# Altium project turn-signal-indicator.PrjPcb
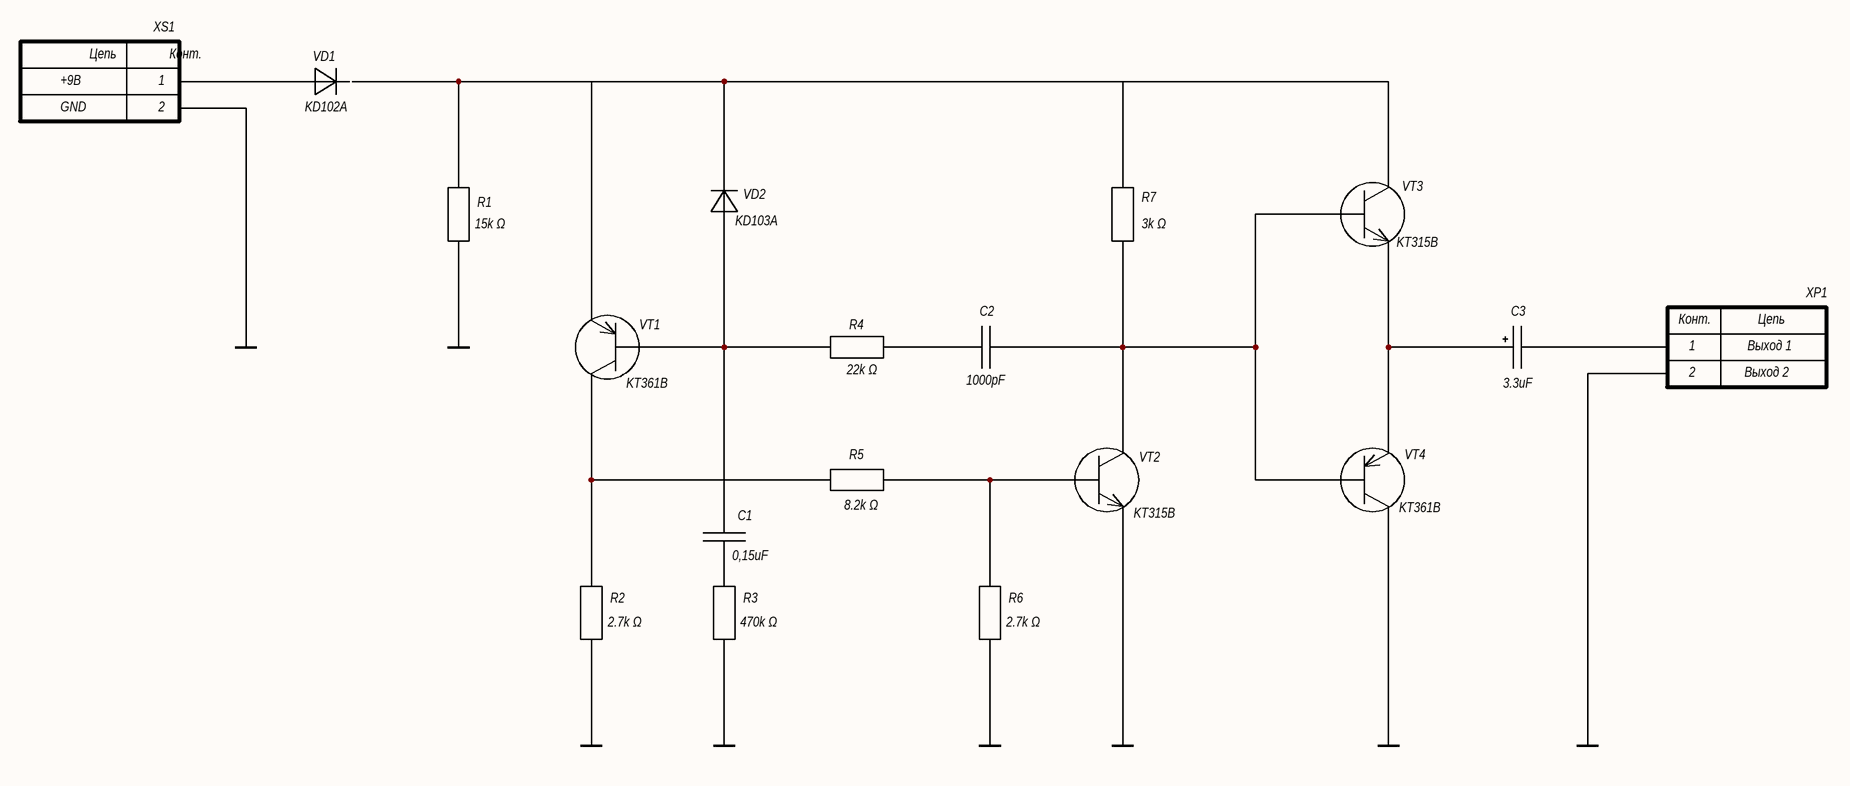
[diagram p0: turn-signal-indicator_E3_schematic.SchDoc]
2 sheets, 18 parts. Net scope: global (net labels, ports and power ports of the same name join across sheets).
Board file: turn-signal-indicator.PcbDoc
Sheets:
  turn-signal-indicator_E3_schematic.SchDoc
  turn-signal-indicator_E1_block-diagram.SchDoc

## Sheet turn-signal-indicator_E3_schematic.SchDoc: Звуковой сигнализатор
size 420 x 297 mm; CheckedBy: Семенцов С.Г.; Author: Советников М.М.; CompanyName: МГТУ им. Н.Э. Баумана Кафедра ИУ4 Группа ИУ4-52Б; DocumentNumber: ИУ4.11.03.03.24.05.52.18.001 Э3; SheetNumber: 1; SheetTotal: 2; Title2str: указателя поворотов; DocumentType: Схема электрическая принципиальная; FirstReferrence: ИУ4.11.03.03.24.05.52.18.001

### Parts
C1  0,15uF  [C_KM5B_1000]
C2  1000pF  [C_KM5B_1000]
C3  3.3uF  [C_KM50-35]
R1  15k Ω  [R_CF-25_C1-4]
R2  2.7k Ω  [R_CF-25_C1-4]
R3  470k Ω  [R_CF-25_C1-4]
R4  22k Ω  [R_CF-25_C1-4]
R5  8.2k Ω  [R_CF-25_C1-4]
R6  2.7k Ω  [R_CF-25_C1-4]
R7  3k Ω  [R_CF-25_C1-4]
VD1  KD102A  [VD_KD30]
VD2  KD103A  [VD_KD30]
VT1  KT361B  [VT_KT-13]
VT2  KT315B  [VT_KT-13]
VT3  KT315B  [VT_KT-13]
VT4  KT361B  [VT_KT-13]
XP1  KLS 2Pin 5.0mm  [X_2Pin_5.0mm]  (value not drawn)
XS1  KLS 2Pin 5.0mm  [X_2Pin_5.0mm]  (value not drawn)

### Nets
GND: R1.1 R2.1 R3.2 R6.1 VT2.3(Э) VT4.2(К) XP1.2 XS1.2
NetC1_1: C1.1 R3.1
NetC1_2: C1.2 R4.2 VD2.1 VT1.1(Б)
NetC2_1: C2.1 R7.1 VT2.2(К) VT3.1(Б) VT4.1(Б)
NetC2_2: C2.2 R4.1
NetC3_1: C3.1 VT3.3(Э) VT4.3(Э)
NetC3_2: C3.2 XP1.1
NetR1_2: R1.2 R7.2 VD2.2 VT1.3(Э) VT3.2(К)
NetR2_2: R2.2 R5.2 VT1.2(К)
NetR5_1: R5.1 R6.2 VT2.1(Б)
NetVD1_1: VD1.1 XS1.1

Not connected (* = marked no-connect by the designer): VD1 2

### Notes on the sheet
- +9В
- GND
- Выход 1
- Выход 2
- ИУ4.11.03.03.24.05.52.18.001 Э3
- Перв. примен.
- ИУ4.11.03.03.24.05.52.18.001
- Справ. №
- Подп. и дата
- Инв. № дубл.
- Взам. инв. №
- Разраб.
- Изм.
- Лист
- № докум.
- Подп.
- Дата
- Лит.
- Масса
- Масштаб
- Пров.
- Т.контр.
- Листов
- 1
- Инв. № подл.
- Утв.
- Н.контр.
- Кафедра ИУ4
- Группа ИУ4-52Б
- МГТУ им. Н.Э. Баумана
- 2.106-A3
- Копировал
- Формат А3
- (in symbol XP_Connector_2Pin) Конт.; Цепь
- (in symbol XS_Connector_2Pin) Цепь; Конт.

### Library data of the parts
C1 = C_NonPolarized: Non-polarized capacitor 40V 20%; Value: 0,15uF
C2 = C_NonPolarized: Non-polarized capacitor 160V 10%; Value: 1000pF
C3 = C_Polarized: Polarized capacitor 50V 20%; Value: 3.3uF
R1-R7 = R_Resistor: Carbon film resistor ±5%, 0.25 W
  R1: Value: 15k Ω
  R2 R6: Value: 2.7k Ω
  R3: Value: 470k Ω
  R4: Value: 22k Ω
  R5: Value: 8.2k Ω
  R7: Value: 3k Ω
VD1 VD2 = VD_Diode: Silicon Diode
  VD1: Value: KD102A
  VD2: Value: KD103A
VT1 VT4 = VT_BJT_PNP: PNP bipolar junction transistor; Value: KT361B
VT2 VT3 = VT_BJT_NPN: NPN bipolar junction transistor; Value: KT315B
XP1 = XP_Connector_2Pin: 2-pin connector (plug); Value: KLS 2Pin 5.0mm
XS1 = XS_Connector_2Pin: 2-pin connector (socket); Value: KLS 2Pin 5.0mm

## Sheet turn-signal-indicator_E1_block-diagram.SchDoc: Звуковой сигнализатор
size 420 x 297 mm; CheckedBy: Семенцов С.Г.; Author: Советников М.М.; SheetNumber: 2; SheetTotal: 2; Title2str: указателя поворотов; DocumentType: Схема электрическая структурная
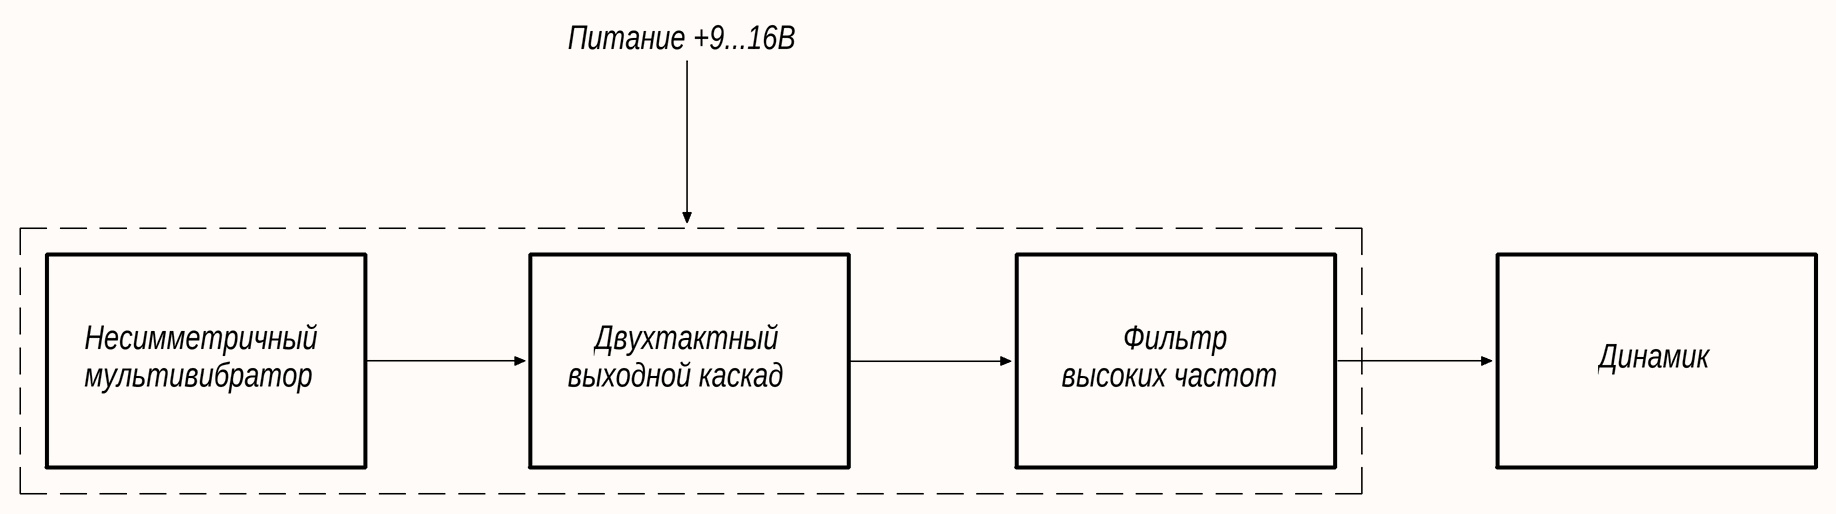
[diagram p1: turn-signal-indicator_E1_block-diagram.SchDoc]

### Notes on the sheet
- Питание +9...16В
- Несимметричный
- Двухтактный
- Фильтр
- мультивибратор
- выходной каскад
- высоких частот
- Динамик
- ИУ4.11.03.03.24.05.52.18.001 Э1
- ИУ4.11.03.03.24.05.52.18.001
- Перв. примен.
- Справ. №
- Подп. и дата
- Инв. № дубл.
- Взам. инв. №
- Разраб.
- Изм.
- Лист
- № докум.
- Подп.
- Дата
- Лит.
- Масса
- Масштаб
- Пров.
- Т.контр.
- Листов
- 1
- Инв. № подл.
- Утв.
- Н.контр.
- Кафедра ИУ4
- Группа ИУ4-52Б
- МГТУ им. Н.Э. Баумана
- 2.106-A3
- Копировал
- Формат А3